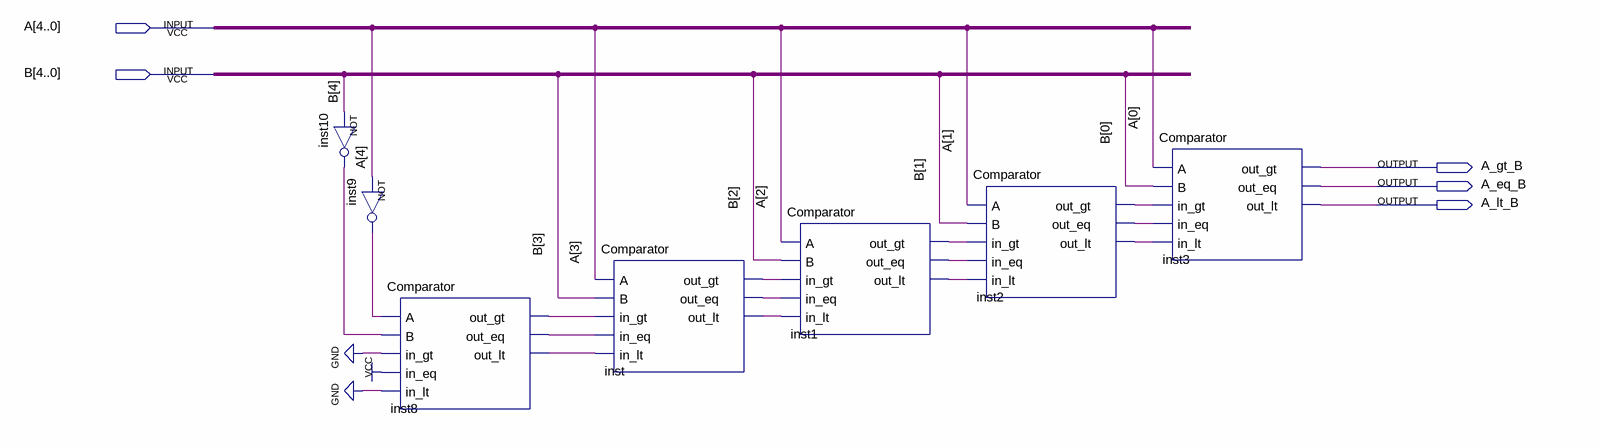
[diagram p0: schematic sheet]
// Quartus schematic Comparator5bits.bdf as structural Verilog: 7 symbols, 5 pins
module Comparator5bits (
  input  [4:0] A,
  input  [4:0] B,
  output A_gt_B,
  output A_eq_B,
  output A_lt_B
);

  wire inst1_out_eq, inst1_out_gt, inst1_out_lt, inst2_out_eq, inst2_out_gt, inst2_out_lt, inst8_out_eq,
       inst8_out_gt, inst8_out_lt, inst9_out, inst10_out, inst_out_eq, inst_out_gt, inst_out_lt;

  not inst10 (inst10_out, B[4]);
  not inst9 (inst9_out, A[4]);
  Comparator inst8 (
    .A(inst9_out), .B(inst10_out), .in_gt(1'b0), .in_eq(1'b1), .in_lt(1'b0), .out_gt(inst8_out_gt),
    .out_eq(inst8_out_eq), .out_lt(inst8_out_lt));
  Comparator inst (
    .A(A[3]), .B(B[3]), .in_gt(inst8_out_gt), .in_eq(inst8_out_eq), .in_lt(inst8_out_lt),
    .out_gt(inst_out_gt), .out_eq(inst_out_eq), .out_lt(inst_out_lt));
  Comparator inst1 (
    .A(A[2]), .B(B[2]), .in_gt(inst_out_gt), .in_eq(inst_out_eq), .in_lt(inst_out_lt), .out_gt(inst1_out_gt),
    .out_eq(inst1_out_eq), .out_lt(inst1_out_lt));
  Comparator inst2 (
    .A(A[1]), .B(B[1]), .in_gt(inst1_out_gt), .in_eq(inst1_out_eq), .in_lt(inst1_out_lt),
    .out_gt(inst2_out_gt), .out_eq(inst2_out_eq), .out_lt(inst2_out_lt));
  Comparator inst3 (
    .A(A[0]), .B(B[0]), .in_gt(inst2_out_gt), .in_eq(inst2_out_eq), .in_lt(inst2_out_lt), .out_gt(A_gt_B),
    .out_eq(A_eq_B), .out_lt(A_lt_B));
endmodule
